# Altium schematic sheet Sheet2.SchDoc: =GlobalProjectName
size 410 x 297 mm; ENG_APP_DATE: --/--/--; DSN_APP_DATE: --/--/--; CHK_APP_DATE: --/--/--; ApprovedBy: Утвердил; CheckedBy: Проверил; Author: Разработал; SheetNumber: Лист; SheetTotal: Листов; PageSetup: Record=PageOptions|CenterHorizontal=True|CenterVertical=True|PrintScale=1.00|XCorrection=1.00|YCorrection=1.00|PrintKind=1|BorderSize=5000000|LeftOffset=0|BottomOffset=0|Orientation=2|PaperLength=1000|PaperWidth=1000|Scale=100|PaperSource=15|PrintQuality=1200|MediaType=1|DitherType=10|PaperKind=A3|PrintScaleMode=1; Weight: -; ScaleFactor: -; NormInspection: Норм.Контр.
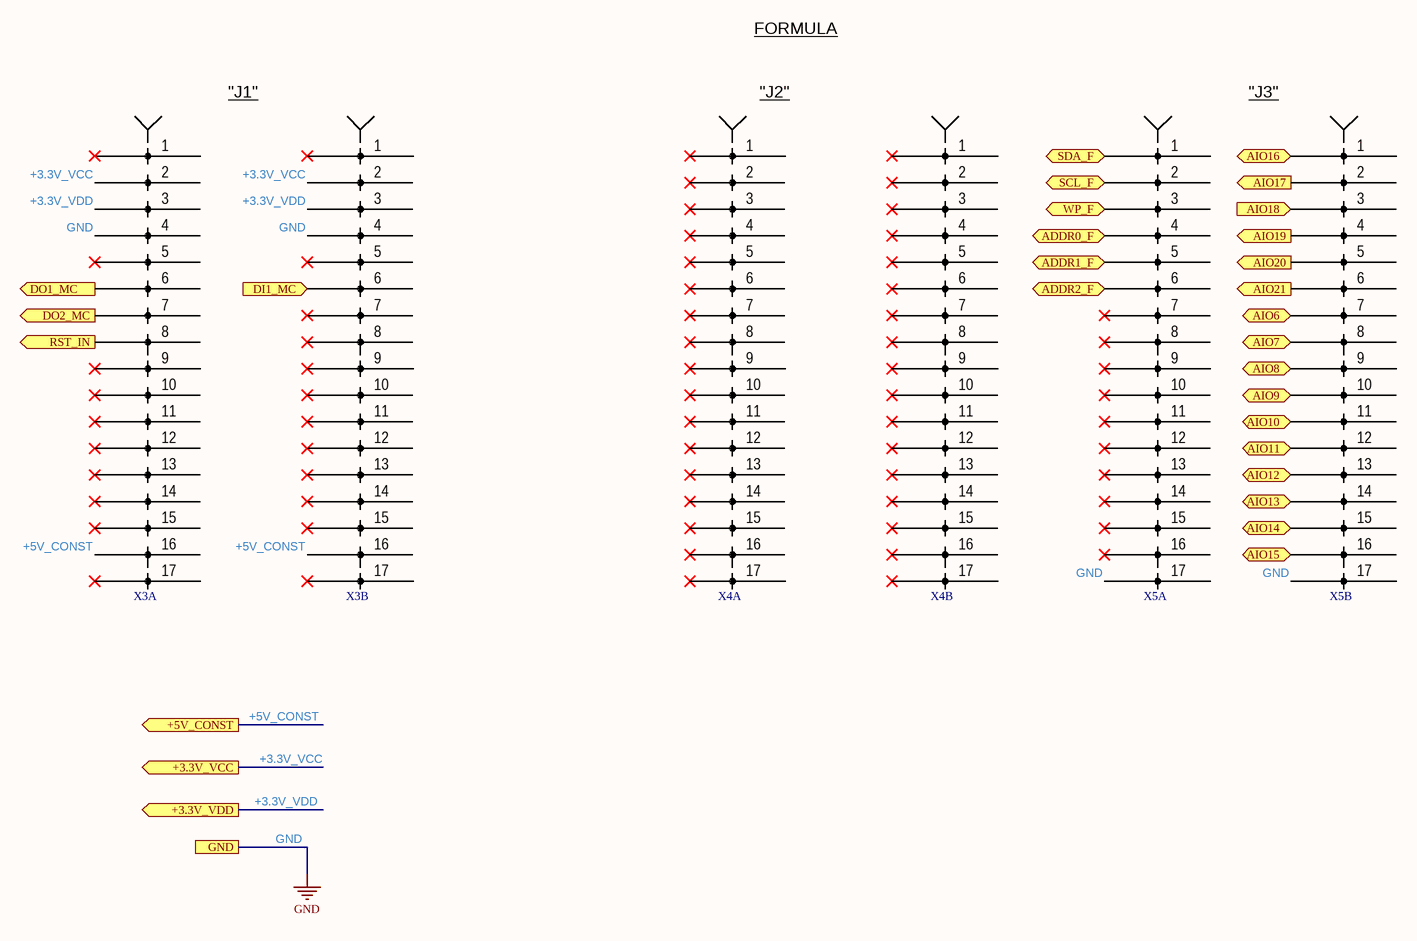
[diagram p0: Sheet2.SchDoc]

## Parts
X3  PLS34-2.54  [PLS34-2.54]  (value not drawn)  (parts A,B of 2)
X4  PLS34-2.54  [PLS34-2.54]  (value not drawn)  (parts A,B of 2)
X5  PLS34-2.54  [PLS34-2.54]  (value not drawn)  (parts A,B of 2)

## Ports
+3.3V_VCC (out), +3.3V_VDD (out), +5V_CONST (out), ADDR0_F (bidir), ADDR1_F (bidir), ADDR2_F (bidir), AIO6 (bidir), AIO7 (bidir), AIO8 (bidir), AIO9 (bidir), AIO10 (bidir), AIO11 (bidir), AIO12 (bidir), AIO13 (bidir), AIO14 (bidir), AIO15 (bidir), AIO16 (bidir), AIO17 (out), AIO18 (in), AIO19 (out), AIO20 (out), AIO21 (out), DI1_MC (in), DO1_MC (out), DO2_MC (out), GND, RST_IN (out), SCL_F (bidir), SDA_F (bidir), WP_F (bidir)

## Nets
GND: X3.4 X3.21 X5.17 X5.34 ; port GND
+3.3V_VCC: X3.2 X3.19 ; port +3.3V_VCC
+3.3V_VDD: X3.3 X3.20 ; port +3.3V_VDD
+5V_CONST: X3.16 X3.33 ; port +5V_CONST
ADDR0_F: X5.4 ; port ADDR0_F
ADDR1_F: X5.5 ; port ADDR1_F
ADDR2_F: X5.6 ; port ADDR2_F
AIO6: X5.24 ; port AIO6
AIO7: X5.25 ; port AIO7
AIO8: X5.26 ; port AIO8
AIO9: X5.27 ; port AIO9
AIO10: X5.28 ; port AIO10
AIO11: X5.29 ; port AIO11
AIO12: X5.30 ; port AIO12
AIO13: X5.31 ; port AIO13
AIO14: X5.32 ; port AIO14
AIO15: X5.33 ; port AIO15
AIO16: X5.18 ; port AIO16
AIO17: X5.19 ; port AIO17
AIO18: X5.20 ; port AIO18
AIO19: X5.21 ; port AIO19
AIO20: X5.22 ; port AIO20
AIO21: X5.23 ; port AIO21
DI1_MC: X3.23 ; port DI1_MC
DO1_MC: X3.6 ; port DO1_MC
DO2_MC: X3.7 ; port DO2_MC
RST_IN: X3.8 ; port RST_IN
SCL_F: X5.2 ; port SCL_F
SDA_F: X5.1 ; port SDA_F
WP_F: X5.3 ; port WP_F

Not connected (* = marked no-connect by the designer): X3 1* 5* 9* 10* 11* 12* 13* 14* 15* 17* 18* 22* 24* 25* 26* 27* 28* 29* 30* 31* 32* 34*; X4 1* 2* 3* 4* 5* 6* 7* 8* 9* 10* 11* 12* 13* 14* 15* 16* 17* 18* 19* 20* 21* 22* 23* 24* 25* 26* 27* 28* 29* 30* 31* 32* 33* 34*; X5 7* 8* 9* 10* 11* 12* 13* 14* 15* 16*

## Notes on the sheet
- FORMULA
- "J1"
- "J2"
- "J3"
- Перв. примен.
- Справ. №
- Подп. и дата
- Инв. № дубл.
- Взам. инв. №
- Разраб.
- Изм.
- Лист
- № докум.
- Подп.
- Дата
- Литера
- Масса
- Масштаб
- Пров.
- Т.контр.
- Листов
- Инв. № подл.
- Н.контр.
- Утв.
- Форма 1 ГОСТ 2.104-2006
- Копировал
- Формат А3